# Altium schematic sheet Pressure_sensor_AFE3.SchDoc
size A4; SheetNumber: 20; SheetTotal: 21
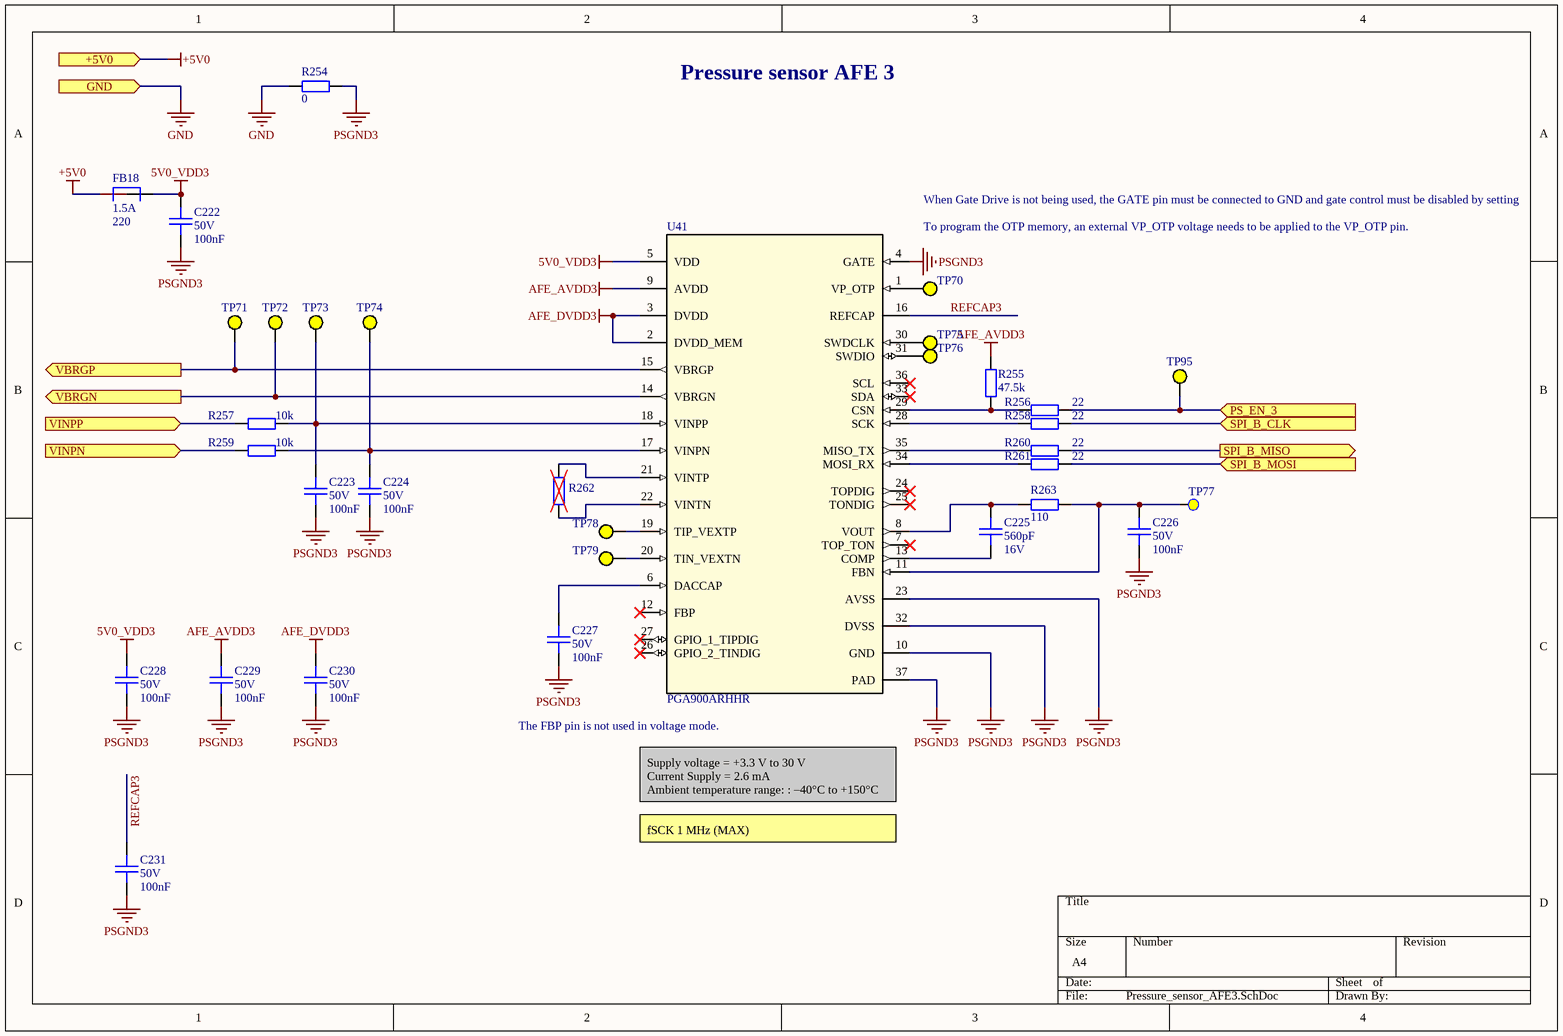
[diagram p0: Pressure_sensor_AFE3.SchDoc]

## Parts
C222  Voltage Rating: 50V  Capacitance: 100nF  [CAPC100x50x50L25]  (hidden comment: GCM155L8EH104KE07D)
C223  Voltage Rating: 50V  Capacitance: 100nF  [CAPC100x50x50L25]  (hidden comment: GCM155L8EH104KE07D)
C224  Voltage Rating: 50V  Capacitance: 100nF  [CAPC100x50x50L25]  (hidden comment: GCM155L8EH104KE07D)
C225  Capacitance: 560pF  Voltage Rating: 16V  [CAPC100x50x50L25]  (hidden comment: C0402C561F4HACAUTO)
C226  Voltage Rating: 50V  Capacitance: 100nF  [CAPC100x50x50L25]  (hidden comment: GCM155L8EH104KE07D)
C227  Voltage Rating: 50V  Capacitance: 100nF  [CAPC100x50x50L25]  (hidden comment: GCM155L8EH104KE07D)
C228  Voltage Rating: 50V  Capacitance: 100nF  [CAPC100x50x50L25]  (hidden comment: GCM155L8EH104KE07D)
C229  Voltage Rating: 50V  Capacitance: 100nF  [CAPC100x50x50L25]  (hidden comment: GCM155L8EH104KE07D)
C230  Voltage Rating: 50V  Capacitance: 100nF  [CAPC100x50x50L25]  (hidden comment: GCM155L8EH104KE07D)
C231  Voltage Rating: 50V  Capacitance: 100nF  [CAPC100x50x50L25]  (hidden comment: GCM155L8EH104KE07D)
FB18  Imax: 1.5A  Impedance: 220  [BEADC160X80X95L40]  (hidden comment: BLM18KG221BH1D)
R254  Resistance: 0  [RESC160X80X55L30]  (hidden comment: RC0603FR-070RL)
R255  Resistance: 47.5k  [RESC100X50X40L25]  (hidden comment: RC0402FR-0747K5L)
R256  Resistance: 22  [RESC100X50X40L25]  (hidden comment: RC0402FR-0722RL)
R257  Resistance: 10k  [RESC100X50X40L25]  (hidden comment: RC0402FR-0710KL)
R258  Resistance: 22  [RESC100X50X40L25]  (hidden comment: RC0402FR-0722RL)
R259  Resistance: 10k  [RESC100X50X40L25]  (hidden comment: RC0402FR-0710KL)
R260  Resistance: 22  [RESC100X50X40L25]  (hidden comment: RC0402FR-0722RL)
R261  Resistance: 22  [RESC100X50X40L25]  (hidden comment: RC0402FR-0722RL)
R262  DNP chip res 0603  [RESC160X80X55L30]  (value not drawn)
R263  Resistance: 110  [RESC100X50X40L25]  (hidden comment: RC0402FR-07110RL)
TP70  Test Point  [TP_D1.5mm]  (value not drawn)  (no BOM)
TP71  Test Point  [TP_D0.75mm]  (value not drawn)
TP72  Test Point  [TP_D0.75mm]  (value not drawn)
TP73  Test Point  [TP_D0.75mm]  (value not drawn)
TP74  Test Point  [TP_D0.75mm]  (value not drawn)
TP75  Test Point  [TP_D1.5mm]  (value not drawn)  (no BOM)
TP76  Test Point  [TP_D1.5mm]  (value not drawn)  (no BOM)
TP77  TPAD  [PAD_1.0R]  (value not drawn)  (no BOM)
TP78  Test Point  [TP_D1.5mm]  (value not drawn)  (no BOM)
TP79  Test Point  [TP_D1.5mm]  (value not drawn)  (no BOM)
TP95  Test Point  [TP_D0.75mm]  (value not drawn)
U41  PGA900ARHHR  [36VQFN]

## Ports
+5V0 (in), GND (in), PS_EN_3 (in), SPI_B_CLK (in), SPI_B_MISO (out), SPI_B_MOSI (in), VBRGN (out), VBRGP (out), VINPN (in), VINPP (in)

## Nets
5V0_VDD3: C222.2 C228.2 FB18.2 U41.5(VDD)
+5V0: FB18.1 ; port +5V0
AFE_AVDD3: C229.2 R255.2 U41.9(AVDD)
AFE_DVDD3: C230.2 U41.2(DVDD_MEM) U41.3(DVDD)
GND: R254.2 ; port GND
PSGND3: C222.1 C223.1 C224.1 C226.1 C227.1 C228.1 C229.1 C230.1 C231.1 R254.1 U41.4(GATE) U41.10(GND) U41.23(AVSS) U41.32(DVSS) U41.37(PAD)
PS_EN_3: R256.2 TP95.1 ; port PS_EN_3
REFCAP3: C231.2 U41.16(REFCAP)
SPI_B_CLK: R258.2 ; port SPI_B_CLK
SPI_B_MISO: R260.2 ; port SPI_B_MISO
SPI_B_MOSI: R261.2 ; port SPI_B_MOSI
VBRGN: TP72.1 U41.14(VBRGN) ; port VBRGN
VBRGP: TP71.1 U41.15(VBRGP) ; port VBRGP
VINPN: R259.1 ; port VINPN
VINPP: R257.1 ; port VINPP
NetC223_2: C223.2 R257.2 TP73.1 U41.18(VINPP)
NetC224_2: C224.2 R259.2 TP74.1 U41.17(VINPN)
NetC225_1: C225.1 U41.13(COMP)
NetC225_2: C225.2 R263.1 U41.8(VOUT)
NetC226_2: C226.2 R263.2 TP77.1(TPoint) U41.11(FBN)
NetC227_2: C227.2 U41.6(DACCAP)
NetR255_1: R255.1 R256.1 U41.29(CSN)
NetR258_1: R258.1 U41.28(SCK)
NetR260_1: R260.1 U41.35(MISO_TX)
NetR261_1: R261.1 U41.34(MOSI_RX)
NetR262_1: R262.1 U41.22(VINTN)
NetR262_2: R262.2 U41.21(VINTP)
NetTP70_1: TP70.1 U41.1(VP_OTP)
NetTP75_1: TP75.1 U41.30(SWDCLK)
NetTP76_1: TP76.1 U41.31(SWDIO)
NetTP78_1: TP78.1 U41.19(TIP_VEXTP)
NetTP79_1: TP79.1 U41.20(TIN_VEXTN)

Not connected (* = marked no-connect by the designer): U41 7(TOP_TON)* 12(FBP)* 24(TOPDIG)* 25(TONDIG)* 26(GPIO_2_TINDIG)* 27(GPIO_1_TIPDIG)* 33(SDA)* 36(SCL)*

## Notes on the sheet
- Pressure sensor AFE 3
- To program the OTP memory, an external VP_OTP voltage needs to be applied to the VP_OTP pin.
- When Gate Drive is not being used, the GATE pin must be connected to GND and gate control must be disabled by setting
- (near U41) The FBP pin is not used in voltage mode.
- Supply voltage = +3.3 V to 30 V
  Current Supply = 2.6 mA
  Ambient temperature range: : –40°C to +150°C
- fSCK 1 MHz (MAX)

## Library data of the parts
C222-C224 C226-C231 = CMP-001-1980-2: CAP CER 0.1UF 50V X8L 0402; Manufacturer: Murata Electronics; Op Temp max: 150°C; Op Temp min: -55°C; Tolerance: 10%; Height max: 550µm; ComponentLink3Description: Digikey; Mounting Type: SM; ComponentLink3URL: https://www.digikey.com/en/products/detail/murata-electronics/GCM155L8EH104KE07D/11618823; Package: 0402 (1005 Metric); Lead Spacing: 0mm; MPN: GCM155L8EH104KE07D; Size: 1.00mm x 0.50mm; Ratings: AEC-Q200; ComponentLink1URL: https://www.murata.com/en-us/products/productdetail?partno=GCM155L8EH104KE07%23; ComponentLink1Description: Datasheet; Dielectric: X8L; ComponentLink2Description: Mouser; ComponentLink2URL: https://eu.mouser.com/ProductDetail/Murata-Electronics/GCM155L8EH104KE07D?qs=1mbolxNpo8fQSHf0HYnZWw%3D%3D
C225 = CMP-001-2011-2: CAP CER 0402 560PF 16V ULTRA STA; Manufacturer: KEMET; Dielectric: X8R; Tolerance: 1%; Op Temp max: 150°C; Op Temp min: -55°C; Package: 0402 (1005 Metric); MPN: C0402C561F4HACAUTO; ComponentLink3Description: Digikey; Mounting Type: SM; Height max: 550µm; Lead Spacing: 0mm; ComponentLink1Description: Datasheet; ComponentLink3URL: https://www.digikey.com/en/products/detail/kemet/C0402C561F4HACAUTO/7955183?s=N4IgjCBcpgbFoDGUBmBDANgZwKYBoQB7KAbRAGYBOMAVgA4QBdAgBwBcoQBlNgJwEsAdgHMQAXwJgA7AhDJI6bPiKkQAFgBMGzfGYh2nHgJHiCGmhtnzFuAsUhltGyuQh6DkbnyGiJ4SnSUVqiYtioOIAAMTH4akWpB0HIhSnaqNLCRAAQsAGJMrByeAKqC-GwA8igAsjhoWACuvDimIAC0lknyfA3K9mQ0MbHpmSwoMUA; ComponentLink2URL: https://eu.mouser.com/ProductDetail/KEMET/C0402C561F4HACAUTO?qs=j%252B1pi9TdxUZljUlO6hXHJQ%3D%3D; ComponentLink2Description: Mouser; ComponentLink1URL: https://www.kemet.com/en/us/product/C0402C561F4HACAUTO.html; Ratings: AEC-Q200; Size: 1.00mm x 0.50mm
FB18 = CMP-001-1981-1: FERRITE BEAD 220 OHM 0603 1LN; Manufacturer: Murata Electronics; DCR: 50m; Op Temp min: -55°C; Frequency: 100MHz; Op Temp max: 150°C; Number of Lines: 1; Mounting Type: SM; Size: 1.60mm x 0.80mm; ComponentLink2URL: https://eu.mouser.com/ProductDetail/Murata-Electronics/BLM18KG221BH1D?qs=sJ5gq5MLFXpgEHYBdWUtkQ%3D%3D; ComponentLink1Description: Datasheet; ComponentLink1URL: https://www.murata.com/en-us/products/productdata/8798137286686/QNFA9129.pdf; Lead Spacing: 0mm; Ratings: AEC-Q200; ComponentLink3Description: Digikey; ComponentLink3URL: https://www.digikey.com/en/products/detail/murata-electronics/BLM18KG221BH1D/6156000; Height max: 950µm; Package: 0603 (1608 Metric); ComponentLink2Description: Mouser; MPN: BLM18KG221BH1D
R254 = CMP-001-0927-2: RES 0 OHM JUMPER 1/10W 0603; Manufacturer: YAGEO; Op Temp min: -55°C; Op Temp max: 155°C; Power: 100mW; Tolerance: 0%; Height max: 550µm; ComponentLink2URL: https://eu.mouser.com/ProductDetail/YAGEO/RC0603FR-070RL?qs=0yPvnVz5%2FmpDQv43TwvCfw%3D%3D; Temperature Coefficient: -; ComponentLink3Description: Digikey; ComponentLink2Description: Mouser; MPN: RC0603FR-070RL; ComponentLink1URL: https://www.yageo.com/upload/media/product/productsearch/datasheet/rchip/PYu-RC_Group_51_RoHS_L_12.pdf; Ratings: -; Size: 1.60mm x 0.80mm; Composition: Thick Film; Mounting Type: SM; ComponentLink3URL: https://www.digikey.com/en/products/detail/yageo/RC0603FR-070RL/1304008; Package: 0603 (1608 Metric); ComponentLink1Description: Datasheet
R255 = CMP-001-0277-7: RES 47.5K OHM 1% 1/16W 0402; Manufacturer: YAGEO; Op Temp min: -55°C; Power: 63mW; Temperature Coefficient: ±100ppm; Op Temp max: 155°C; ComponentLink1URL: https://www.yageo.com/upload/media/product/productsearch/datasheet/rchip/PYu-RC_Group_51_RoHS_L_12.pdf; ComponentLink1Description: Datasheet; MPN: RC0402FR-0747K5L; ComponentLink3Description: Digikey; ComponentLink2URL: https://eu.mouser.com/ProductDetail/YAGEO/RC0402FR-0747K5L?qs=V1yeUXFNrklfu86Rfgihxg%3D%3D; Mounting Type: SM; Tolerance: 1%; Package: 0402 (1005 Metric); Height max: 400µm; ComponentLink2Description: Mouser; ComponentLink3URL: https://www.digikey.com/en/products/detail/yageo/RC0402FR-0747K5L/726617; Size: 1.00mm x 0.50mm; Composition: Thick Film; Ratings: -
R256 R258 R260 R261 = CMP-001-0482-4: RES 22 OHM 1% 1/16W 0402; Manufacturer: YAGEO; Temperature Coefficient: ±100ppm; Op Temp max: 155°C; Op Temp min: -55°C; Power: 63mW; Ratings: -; ComponentLink3URL: https://www.digikey.com/en/products/detail/yageo/RC0402FR-0722RL/726562; ComponentLink2URL: https://eu.mouser.com/ProductDetail/YAGEO/RC0402FR-0722RL?qs=V1yeUXFNrkkRg6zf08ADKQ%3D%3D; MPN: RC0402FR-0722RL; ComponentLink1Description: Datasheet; ComponentLink3Description: Digikey; Tolerance: 1%; Size: 1.00mm x 0.50mm; ComponentLink1URL: https://www.yageo.com/upload/media/product/productsearch/datasheet/rchip/PYu-RC_Group_51_RoHS_L_12.pdf; Composition: Thick Film; ComponentLink2Description: Mouser; Mounting Type: SM; Package: 0402 (1005 Metric); Height max: 400µm
R257 R259 = CMP-00010-6: RES 10K OHM 1% 1/16W 0402; Manufacturer: YAGEO; Op Temp max: 155°C; Op Temp min: -55°C; Power: 63mW; Temperature Coefficient: ±100ppm; ComponentLink3URL: https://www.digikey.com/en/products/detail/yageo/RC0402FR-0710KL/726523; ComponentLink1Description: Datasheet; Height max: 400µm; ComponentLink3Description: Digikey; ComponentLink2URL: https://www2.mouser.com/ProductDetail/YAGEO/RC0402FR-0710KL?qs=%2Fha2pyFaduhjtLcYvKXQ8NAGbRXkQ%2Fwl6RsvWHeV66MSeqLhkcF3rg%3D%3D; Ratings: -; MPN: RC0402FR-0710KL; ComponentLink1URL: https://www.yageo.com/upload/media/product/productsearch/datasheet/rchip/PYu-RC_Group_51_RoHS_L_12.pdf; ComponentLink2Description: Mouser; Mounting Type: SM; Tolerance: 1%; Composition: Thick Film; Size: 1.00mm x 0.50mm; Package: 0402 (1005 Metric)
R262 = CMP-001-0920-3: DNP res 0603; Mounting Type: SM; MPN: DNP; Package: 0603 (1608 Metric)
R263 = CMP-001-0497-6: RES 110 OHM 1% 1/16W 0402; Manufacturer: YAGEO; Power: 63mW; Op Temp min: -55°C; Op Temp max: 155°C; Temperature Coefficient: ±100ppm; Size: 1.00mm x 0.50mm; ComponentLink1Description: Datasheet; Package: 0402 (1005 Metric); ComponentLink2URL: https://eu.mouser.com/ProductDetail/YAGEO/RC0402FR-07110RL?qs=QWYorlrD8IXj7iGvwWbRbA%3D%3D; MPN: RC0402FR-07110RL; ComponentLink3Description: Digikey; Height max: 400µm; Ratings: -; ComponentLink3URL: https://www.digikey.com/en/products/detail/yageo/RC0402FR-07110RL/2827583; Composition: Thick Film; ComponentLink2Description: Mouser; Tolerance: 1%; Mounting Type: SM; ComponentLink1URL: https://www.yageo.com/upload/media/product/productsearch/datasheet/rchip/PYu-RC_Group_51_RoHS_L_12.pdf
TP70 TP75 TP76 TP78 TP79 = TP_1.5
TP71-TP74 TP95 = TP_0.75: Test point 0.75mm
TP77 = TPAD: Test Pad, SMD; Group: Test point
U41 = PGA900ARHHR: IC PROG SENSOR SGNL COND 36VQFN; Manufacturer: Texas Instruments; MPN: PGA900ARHHR